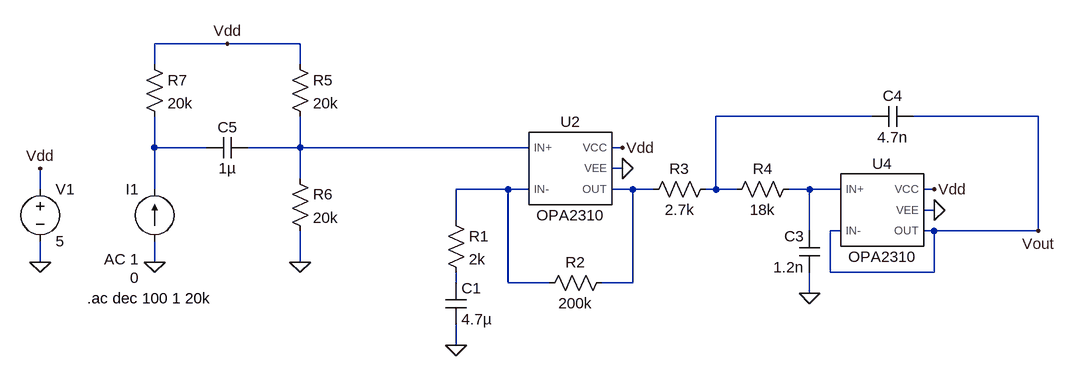
[diagram p0: schematic opa310-preamp-sallenkey.asc]
opa310-preamp-sallenkey.asc, the LTspice schematic file:
Version 4
SHEET 1 956 680
WIRE -400 -128 -512 -128
WIRE -288 -128 -400 -128
WIRE -512 -96 -512 -128
WIRE -288 -96 -288 -128
WIRE 592 -16 352 -16
WIRE 848 -16 656 -16
WIRE -512 32 -512 -16
WIRE -432 32 -512 32
WIRE -288 32 -288 -16
WIRE -288 32 -368 32
WIRE 64 32 -288 32
WIRE 208 32 192 32
WIRE 208 64 192 64
WIRE -288 80 -288 32
WIRE -688 96 -688 64
WIRE -512 96 -512 32
WIRE 32 96 -48 96
WIRE 64 96 32 96
WIRE 224 96 192 96
WIRE 256 96 224 96
WIRE 352 96 352 -16
WIRE 352 96 336 96
WIRE 384 96 352 96
WIRE 496 96 464 96
WIRE 544 96 496 96
WIRE 688 96 672 96
WIRE 688 128 672 128
WIRE -48 144 -48 96
WIRE 496 160 496 96
WIRE 544 160 528 160
WIRE 688 160 672 160
WIRE 848 160 848 -16
WIRE 848 160 688 160
WIRE -688 208 -688 176
WIRE -512 208 -512 176
WIRE -288 208 -288 160
WIRE 528 224 528 160
WIRE 688 224 688 160
WIRE 688 224 528 224
WIRE -48 240 -48 224
WIRE 32 240 32 96
WIRE 96 240 32 240
WIRE 224 240 224 96
WIRE 224 240 176 240
WIRE 496 256 496 224
WIRE -48 336 -48 304
FLAG 496 256 0
FLAG -688 208 0
FLAG -688 64 Vdd
FLAG 848 160 Vout
FLAG -512 208 0
FLAG -48 336 0
FLAG 688 96 Vdd
FLAG 688 128 0
FLAG 208 64 0
FLAG 208 32 Vdd
FLAG -400 -128 Vdd
FLAG -288 208 0
SYMBOL res -64 128 R0
SYMATTR InstName R1
SYMATTR Value 2k
SYMBOL cap -64 240 R0
SYMATTR InstName C1
SYMATTR Value 4.7µ
SYMBOL res 192 224 R90
WINDOW 0 0 56 VBottom 2
WINDOW 3 32 56 VTop 2
SYMATTR InstName R2
SYMATTR Value 200k
SYMBOL res 352 80 R90
WINDOW 0 0 56 VBottom 2
WINDOW 3 32 56 VTop 2
SYMATTR InstName R3
SYMATTR Value 2.7k
SYMBOL res 480 80 R90
WINDOW 0 0 56 VBottom 2
WINDOW 3 32 56 VTop 2
SYMATTR InstName R4
SYMATTR Value 18k
SYMBOL cap 512 224 R180
WINDOW 0 24 56 Left 2
WINDOW 3 24 8 Left 2
SYMATTR InstName C3
SYMATTR Value 1.2n
SYMBOL cap 592 0 R270
WINDOW 0 32 32 VTop 2
WINDOW 3 0 32 VBottom 2
SYMATTR InstName C4
SYMATTR Value 4.7n
SYMBOL voltage -688 80 R0
WINDOW 123 0 0 Left 0
WINDOW 39 0 0 Left 0
SYMATTR InstName V1
SYMATTR Value 5
SYMBOL OPA2310 128 64 R0
SYMATTR InstName U2
SYMBOL OPA2310 608 128 R0
SYMATTR InstName U4
SYMBOL res -304 -112 R0
SYMATTR InstName R5
SYMATTR Value 20k
SYMBOL res -304 64 R0
SYMATTR InstName R6
SYMATTR Value 20k
SYMBOL cap -368 16 R90
WINDOW 0 0 32 VBottom 2
WINDOW 3 32 32 VTop 2
SYMATTR InstName C5
SYMATTR Value 1µ
SYMBOL res -528 -112 R0
SYMATTR InstName R7
SYMATTR Value 20k
SYMBOL current -512 176 R180
WINDOW 0 24 80 Left 2
WINDOW 3 24 -56 Left 2
WINDOW 123 24 -28 Left 2
WINDOW 39 0 0 Left 0
SYMATTR InstName I1
SYMATTR Value 0
SYMATTR Value2 AC 1
TEXT -616 264 Left 2 !.ac dec 100 1 20k

The netlist it stands for:
* opa310-preamp-sallenkey.asc
R1 N004 N007 2k
C1 N007 0 4.7µ
R2 N005 N004 200k
R3 N001 N005 2.7k
R4 N006 N001 18k
C3 0 N006 1.2n
C4 N001 Vout 4.7n
V1 Vdd 0 5
XU2 N005 Vdd N003 N004 0 OPA2310  ; pins OUT VCC IN+ IN- VEE
XU4 Vout Vdd N006 Vout 0 OPA2310  ; pins OUT VCC IN+ IN- VEE
R5 Vdd N003 20k
R6 N003 0 20k
C5 N003 N002 1µ
R7 Vdd N002 20k
I1 0 N002 0 AC 1
.ac dec 100 1 20k
.lib Z:\home\harry\recap\instrumentation\hw\board-v3\design\opa310.sp
.backanno
.end